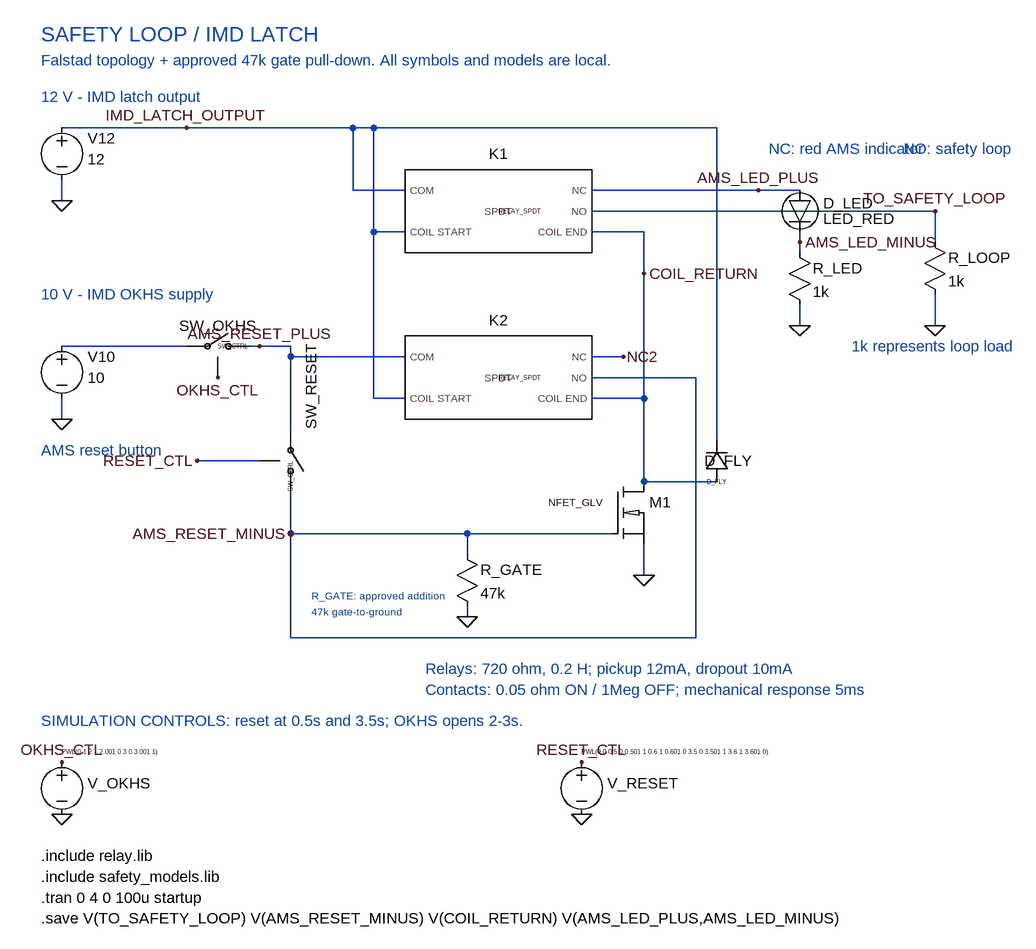
[diagram p0: schematic safety_loop.asc]
safety_loop.asc, the LTspice schematic file:
Version 4.1
SHEET 1 1720 1400
WIRE 304 96 112 96
WIRE 560 96 304 96
WIRE 592 96 560 96
WIRE 1120 96 592 96
WIRE 560 192 560 96
WIRE 640 192 560 192
WIRE 1184 192 928 192
WIRE 1248 192 1184 192
WIRE 112 208 112 176
WIRE 1456 224 928 224
WIRE 592 256 592 96
WIRE 640 256 592 256
WIRE 1008 256 928 256
WIRE 1248 272 1248 256
WIRE 1456 272 1456 224
WIRE 1248 288 1248 272
WIRE 1008 320 1008 256
WIRE 1248 400 1248 368
WIRE 1456 400 1456 352
WIRE 304 432 112 432
WIRE 416 432 400 432
WIRE 464 432 416 432
WIRE 464 448 464 432
WIRE 640 448 464 448
WIRE 976 448 928 448
WIRE 1088 480 928 480
WIRE 592 512 592 256
WIRE 640 512 592 512
WIRE 1008 512 1008 320
WIRE 1008 512 928 512
WIRE 112 544 112 512
WIRE 464 560 464 448
WIRE 1120 576 1120 96
WIRE 416 608 320 608
WIRE 1008 640 1008 512
WIRE 1120 640 1008 640
WIRE 464 720 464 656
WIRE 736 720 464 720
WIRE 960 720 736 720
WIRE 736 752 736 720
WIRE 1008 784 1008 736
WIRE 736 848 736 832
WIRE 464 880 464 720
WIRE 1088 880 1088 480
WIRE 1088 880 464 880
FLAG 112 208 0
FLAG 304 96 IMD_LATCH_OUTPUT
FLAG 1008 320 COIL_RETURN
FLAG 976 448 NC2
FLAG 1248 400 0
FLAG 1184 192 AMS_LED_PLUS
FLAG 1248 272 AMS_LED_MINUS
FLAG 1456 400 0
FLAG 1456 224 TO_SAFETY_LOOP
FLAG 112 544 0
FLAG 352 480 OKHS_CTL
FLAG 416 432 AMS_RESET_PLUS
FLAG 320 608 RESET_CTL
FLAG 464 720 AMS_RESET_MINUS
FLAG 1008 784 0
FLAG 736 848 0
FLAG 112 1072 OKHS_CTL
FLAG 112 1152 0
FLAG 912 1072 RESET_CTL
FLAG 912 1152 0
SYMBOL SL_voltage 112 80 R0
WINDOW 0 40 32 Left 2
WINDOW 3 40 64 Left 2
SYMATTR InstName V12
SYMATTR Value 12
SYMBOL RELAY_SPDT 784 224 R0
SYMATTR InstName K1
SYMBOL RELAY_SPDT 784 480 R0
SYMATTR InstName K2
SYMBOL LED_IMD 1248 192 R0
SYMATTR InstName D_LED
SYMBOL SL_res 1232 272 R0
SYMATTR InstName R_LED
SYMATTR Value 1k
SYMBOL SL_res 1440 256 R0
SYMATTR InstName R_LOOP
SYMATTR Value 1k
SYMBOL SL_diode 1136 640 R180
WINDOW 0 -40 32 Left 2
WINDOW 3 0 0 Left 0
SYMATTR InstName D_FLY
SYMATTR Value D_FLY
SYMBOL SL_voltage 112 416 R0
WINDOW 0 40 32 Left 2
WINDOW 3 40 64 Left 2
SYMATTR InstName V10
SYMATTR Value 10
SYMBOL SW_CTRL 352 432 R0
SYMATTR InstName SW_OKHS
SYMBOL SW_CTRL 464 608 R90
WINDOW 0 -48 -32 Right 2
SYMATTR InstName SW_RESET
SYMBOL SL_nmos 960 640 R0
WINDOW 3 -16 32 Right 1
SYMATTR InstName M1
SYMATTR Value NFET_GLV
SYMBOL SL_res 720 736 R0
SYMATTR InstName R_GATE
SYMATTR Value 47k
SYMBOL SL_voltage 112 1056 R0
WINDOW 0 40 48 Left 2
WINDOW 3 0 0 Left 0
SYMATTR InstName V_OKHS
SYMATTR Value PWL(0 1 2 1 2.001 0 3 0 3.001 1)
SYMBOL SL_voltage 912 1056 R0
WINDOW 0 40 48 Left 2
WINDOW 3 0 0 Left 0
SYMATTR InstName V_RESET
SYMATTR Value PWL(0 0 0.5 0 0.501 1 0.6 1 0.601 0 3.5 0 3.501 1 3.6 1 3.601 0)
TEXT 80 -48 Left 3 ;SAFETY LOOP / IMD LATCH
TEXT 80 -8 Left 2 ;Falstad topology + approved 47k gate pull-down. All symbols and models are local.
TEXT 80 48 Left 2 ;12 V - IMD latch output
TEXT 80 352 Left 2 ;10 V - IMD OKHS supply
TEXT 80 592 Left 2 ;AMS reset button
TEXT 1200 128 Left 2 ;NC: red AMS indicator
TEXT 1408 128 Left 2 ;NO: safety loop
TEXT 1328 432 Left 2 ;1k represents loop load
TEXT 672 928 Left 2 ;Relays: 720 ohm, 0.2 H; pickup 12mA, dropout 10mA
TEXT 672 960 Left 2 ;Contacts: 0.05 ohm ON / 1Meg OFF; mechanical response 5ms
TEXT 496 816 Left 1 ;R_GATE: approved addition
TEXT 496 840 Left 1 ;47k gate-to-ground
TEXT 80 1008 Left 2 ;SIMULATION CONTROLS: reset at 0.5s and 3.5s; OKHS opens 2-3s.
TEXT 80 1216 Left 2 !.include relay.lib
TEXT 80 1248 Left 2 !.include safety_models.lib
TEXT 80 1280 Left 2 !.tran 0 4 0 100u startup
TEXT 80 1312 Left 2 !.save V(TO_SAFETY_LOOP) V(AMS_RESET_MINUS) V(COIL_RETURN) V(AMS_LED_PLUS,AMS_LED_MINUS)

The netlist it stands for:
* safety_loop.asc
V12 IMD_LATCH_OUTPUT 0 12
X§K1 IMD_LATCH_OUTPUT IMD_LATCH_OUTPUT AMS_LED_PLUS TO_SAFETY_LOOP COIL_RETURN RELAY_SPDT  ; pins COM COIL_START NC NO COIL_END
X§K2 AMS_RESET_PLUS IMD_LATCH_OUTPUT NC2 AMS_RESET_MINUS COIL_RETURN RELAY_SPDT  ; pins COM COIL_START NC NO COIL_END
D_LED AMS_LED_PLUS AMS_LED_MINUS LED_RED
R_LED AMS_LED_MINUS 0 1k
R_LOOP TO_SAFETY_LOOP 0 1k
D_FLY COIL_RETURN IMD_LATCH_OUTPUT D_FLY
V10 N001 0 10
X§SW_OKHS N001 AMS_RESET_PLUS OKHS_CTL SW_CTRL  ; pins A B CTRL
X§SW_RESET AMS_RESET_PLUS AMS_RESET_MINUS RESET_CTL SW_CTRL  ; pins A B CTRL
M1 COIL_RETURN AMS_RESET_MINUS 0 0 NFET_GLV
R_GATE AMS_RESET_MINUS 0 47k
V_OKHS OKHS_CTL 0 PWL(0 1 2 1 2.001 0 3 0 3.001 1)
V_RESET RESET_CTL 0 PWL(0 0 0.5 0 0.501 1 0.6 1 0.601 0 3.5 0 3.501 1 3.6 1 3.601 0)
.model D D
.lib standard.dio
.model NMOS NMOS
.model PMOS PMOS
.lib standard.mos
* SAFETY LOOP / IMD LATCH
* Falstad topology + approved 47k gate pull-down. All symbols and models are local.
* 12 V - IMD latch output
* 10 V - IMD OKHS supply
* AMS reset button
* NC: red AMS indicator
* NO: safety loop
* 1k represents loop load
* Relays: 720 ohm, 0.2 H; pickup 12mA, dropout 10mA
* Contacts: 0.05 ohm ON / 1Meg OFF; mechanical response 5ms
* R_GATE: approved addition
* 47k gate-to-ground
* SIMULATION CONTROLS: reset at 0.5s and 3.5s; OKHS opens 2-3s.
.include relay.lib
.include safety_models.lib
.tran 0 4 0 100u startup
.save V(TO_SAFETY_LOOP) V(AMS_RESET_MINUS) V(COIL_RETURN) V(AMS_LED_PLUS,AMS_LED_MINUS)
.backanno
.end